# Altium schematic sheet Mosfet_HBridge_Driver.SchDoc
size A; SheetNumber: 4; SheetTotal: 7
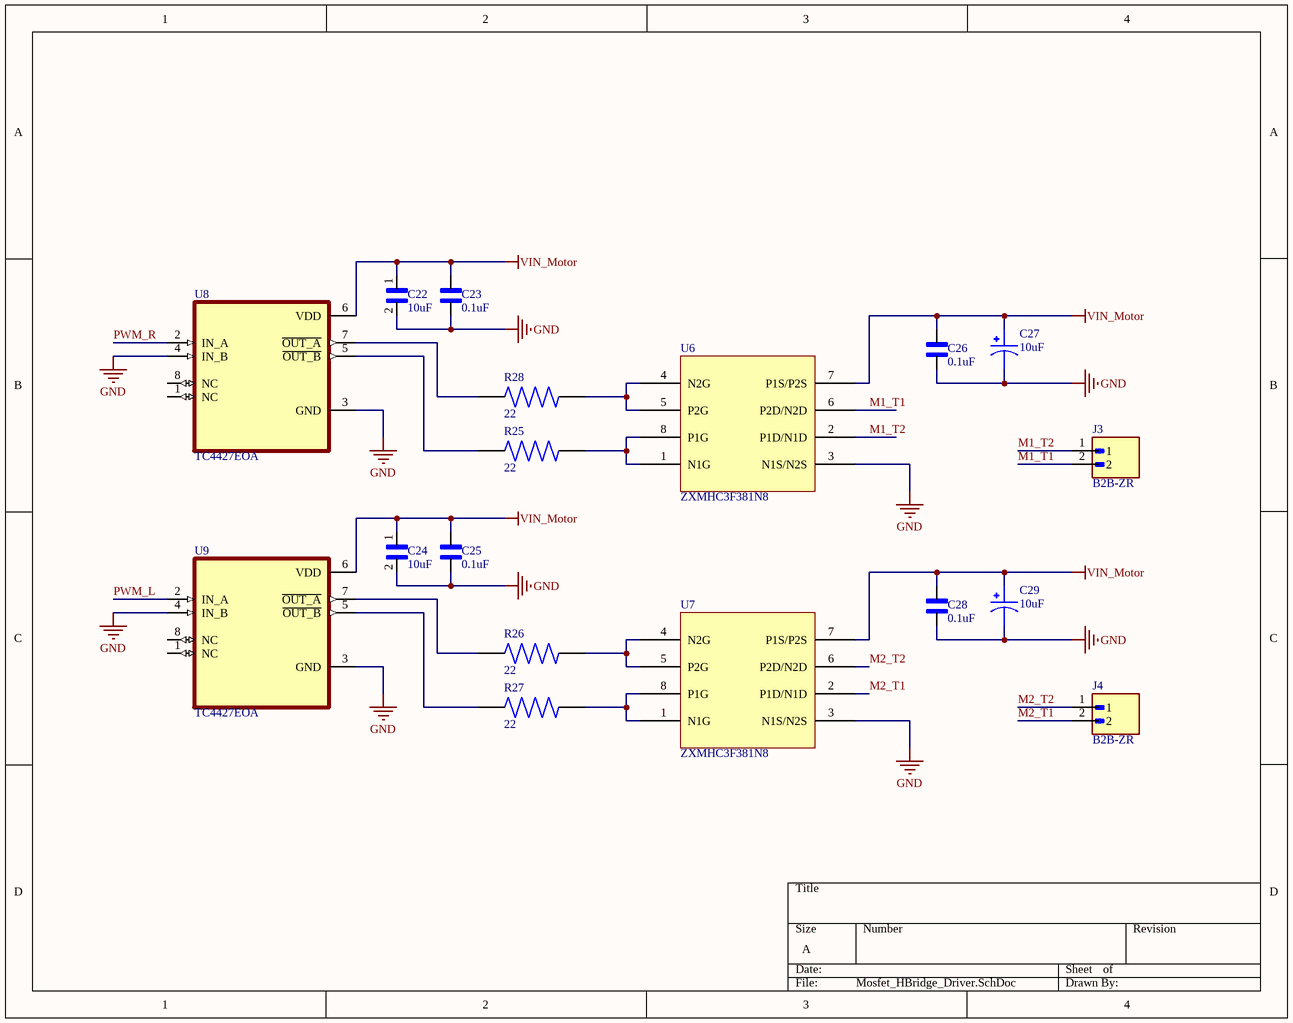
[diagram p0: Mosfet_HBridge_Driver.SchDoc]

## Parts
C22  10uF  [CAPC2012X145N]
C23  0.1uF  [CAPC2012X140N]
C24  10uF  [CAPC2012X145N]
C25  0.1uF  [CAPC2012X140N]
C26  0.1uF  [CAPC2012X140N]
C27  10uF  [CAPAE660X610N]
C28  0.1uF  [CAPC2012X140N]
C29  10uF  [CAPAE660X610N]
J3  B2B-ZR  [JST_B2B-ZR(LF)(SN)]
J4  B2B-ZR  [JST_B2B-ZR(LF)(SN)]
R25  22  [RES_ERJU06F22R0V]
R26  22  [RES_ERJU06F22R0V]
R27  22  [RES_ERJU06F22R0V]
R28  22  [RES_ERJU06F22R0V]
U6  ZXMHC3F381N8  [SOIC127P600X175-8N]
U7  ZXMHC3F381N8  [SOIC127P600X175-8N]
U8  TC4427EOA  [SOIC127P599X175-8N]
U9  TC4427EOA  [SOIC127P599X175-8N]

## Nets
GND: C22.2 C23.1 C24.2 C25.1 C26.1 C27.N(NEG) C28.1 C29.N(NEG) U6.3(N1S/N2S) U7.3(N1S/N2S) U8.3(GND) U8.4(IN_B) U9.3(GND) U9.4(IN_B)
VIN_Motor: C22.1 C23.2 C24.1 C25.2 C26.2 C27.P(POS) C28.2 C29.P(POS) U6.7(P1S/P2S) U7.7(P1S/P2S) U8.6(VDD) U9.6(VDD)
M1_T1: J3.2 U6.6(P2D/N2D)
M1_T2: J3.1 U6.2(P1D/N1D)
M2_T1: J4.2 U7.2(P1D/N1D)
M2_T2: J4.1 U7.6(P2D/N2D)
PWM_L: U9.2(IN_A)
PWM_R: U8.2(IN_A)
NetR25_1: R25.1 U8.5(~{OUT_B})
NetR25_2: R25.2 U6.1(N1G) U6.8(P1G)
NetR26_1: R26.1 U9.7(~{OUT_A})
NetR26_2: R26.2 U7.4(N2G) U7.5(P2G)
NetR27_1: R27.1 U9.5(~{OUT_B})
NetR27_2: R27.2 U7.1(N1G) U7.8(P1G)
NetR28_1: R28.1 U8.7(~{OUT_A})
NetR28_2: R28.2 U6.4(N2G) U6.5(P2G)

Not connected (* = marked no-connect by the designer): U8 1(NC) 8(NC); U9 1(NC) 8(NC)

## Library data of the parts
C22 C24 = C2012X6S1C106K125AC: C Series 0805 10 uF 16 V Â±10 % Tolerance X6S SMT Multilayer Ceramic Capacitor; MF: TDK; MP: C2012X6S1C106K125AC; SnapEDA_Link: https://www.snapeda.com/parts/C2012X6S1C106K125AC/TDK-Lambda+Americas+Inc/view-part/?ref=snap; Check_prices: https://www.snapeda.com/parts/C2012X6S1C106K125AC/TDK-Lambda+Americas+Inc/view-part/?ref=eda; Value: *; Purchase-URL: https://pricing.snapeda.com/search/part/C2012X6S1C106K125AC/?ref=eda; Package: 2012 TDK
C23 C25 C26 C28 = FS055C104K4Z2A: 0.1 ÂµF Â±10% 50V Ceramic Capacitor X7R 0805 (2012 Metric); MF: AVX; SnapEDA_Link: https://www.snapeda.com/parts/FS055C104K4Z2A/AVX/view-part/?ref=snap; Package: 0805-2 AVX; Value: *; MP: FS055C104K4Z2A; Check_prices: https://www.snapeda.com/parts/FS055C104K4Z2A/AVX/view-part/?ref=eda
C27 C29 = UUD1H100MCL1GS: Aluminum Electrolytic Capacitors - SMD, Low Impediance, 50volts 10uF | Nichicon UUD1H100MCL1GS; SnapEDA_Link: https://www.snapeda.com/parts/UUD1H100MCL1GS/Nichicon/view-part/?ref=snap; Package: RADIAL-2 Nichicon; Value: *; MF: Nichicon; MP: UUD1H100MCL1GS; Check_prices: https://www.snapeda.com/parts/UUD1H100MCL1GS/Nichicon/view-part/?ref=eda
J3 J4 = B2B-ZR(LF)(SN): Connector Header Through Hole 2 position 0.059 (1.50mm); MF: JST Sales; SnapEDA_Link: https://www.snapeda.com/parts/B2B-ZR(LF)(SN)/JST+Sales+America+Inc./view-part/?ref=snap; Package: None; Value: *; MP: B2B-ZR(LF)(SN); Check_prices: https://www.snapeda.com/parts/B2B-ZR(LF)(SN)/JST+Sales+America+Inc./view-part/?ref=eda
R25-R28 = ERJU06F22R0V: MP: ERJU06F22R0V; Availability: Unavailable; Price: None; Package: None; Value: *
U6 U7 = ZXMHC3F381N8: N-Channel+P-Channel Array 30V 4.1A 0.95W Surface Mount SO-8
U8 U9 = TC4427EOA: Low-Side Gate Driver IC Non-Inverting 8-SOIC; MF: Microchip; Check_prices: https://www.snapeda.com/parts/TC4427EOA/Microchip/view-part/?ref=eda; Value: *; Availability: In Stock; MP: TC4427EOA; Price: None; Package: SOIC-8 Microchip; SnapEDA_Link: https://www.snapeda.com/parts/TC4427EOA/Microchip/view-part/?ref=snap; Purchase-URL: https://pricing.snapeda.com/search/part/TC4427EOA/?ref=eda